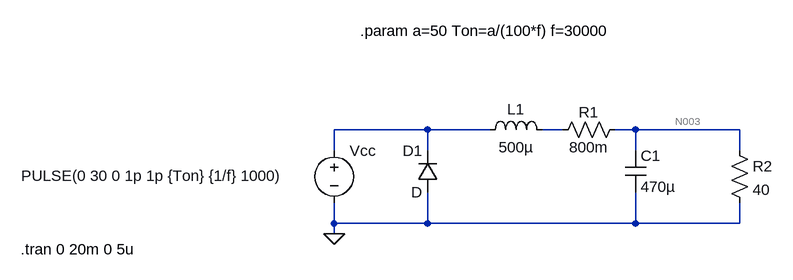
[diagram p0: schematic AlimentationADécoupage.asc]
AlimentationADécoupage.asc, the LTspice schematic file:
Version 4
SHEET 1 880 680
WIRE 192 112 48 112
WIRE 288 112 192 112
WIRE 400 112 368 112
WIRE 512 112 480 112
WIRE 672 112 512 112
WIRE 48 144 48 112
WIRE 192 144 192 112
WIRE 512 144 512 112
WIRE 672 144 672 112
WIRE 48 256 48 224
WIRE 192 256 192 208
WIRE 192 256 48 256
WIRE 512 256 512 208
WIRE 512 256 192 256
WIRE 672 256 672 224
WIRE 672 256 512 256
WIRE 48 272 48 256
FLAG 48 272 0
SYMBOL voltage 48 128 R0
WINDOW 3 -481 55 Left 2
WINDOW 123 0 0 Left 2
WINDOW 39 0 0 Left 2
SYMATTR InstName Vcc
SYMATTR Value PULSE(0 30 0 1p 1p {Ton} {1/f} 1000)
SYMBOL diode 208 208 R180
WINDOW 0 24 64 Left 2
WINDOW 3 24 0 Left 2
SYMATTR InstName D1
SYMBOL ind 272 128 R270
WINDOW 0 32 56 VTop 2
WINDOW 3 5 56 VBottom 2
SYMATTR InstName L1
SYMATTR Value 500µ
SYMBOL res 496 96 R90
WINDOW 0 5 56 VBottom 2
WINDOW 3 27 56 VTop 2
SYMATTR InstName R1
SYMATTR Value 800m
SYMBOL cap 496 144 R0
SYMATTR InstName C1
SYMATTR Value 470µ
SYMBOL res 656 128 R0
SYMATTR InstName R2
SYMATTR Value 40
TEXT 88 -40 Left 2 !.param a=50 Ton=a/(100*f) f=30000
TEXT -434 296 Left 2 !.tran 0 20m 0 5u

The netlist it stands for:
* AlimentationADécoupage.asc
Vcc N001 0 PULSE(0 30 0 1p 1p {Ton} {1/f} 1000)
D1 0 N001 D
L1 N001 N002 500µ
R1 N003 N002 800m
C1 N003 0 470µ
R2 N003 0 40
.model D D
.lib standard.dio
.param a=50 Ton=a/(100*f) f=30000
.tran 0 20m 0 5u
.backanno
.end

* Results of the author's LTspice run, read from the files saved beside the schematic
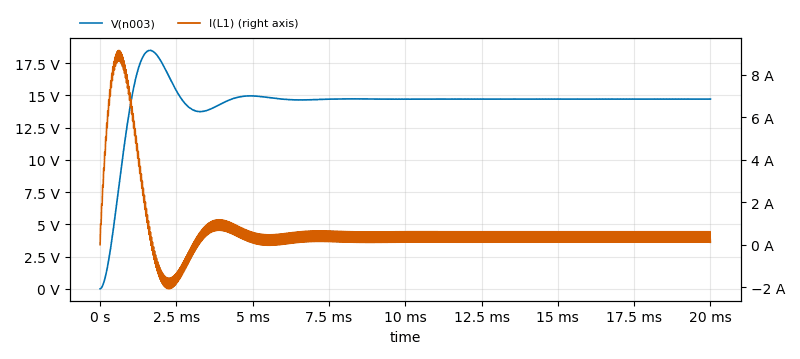
[diagram p1: Transient Analysis of AlimentationADécoupage.asc, plotted from the saved traces]
* Transient Analysis, 1 run:
*   V(n003): min 0 V, max 18.48 V, average 14.43 V, rms 14.61 V, last 14.71 V
*   I(L1): min -2.073 A, max 9.152 A, average 706.3 mA, rms 1.851 A, last 117.6 mA